# Altium schematic sheet EMGfrontend.SchDoc
size A; SheetNumber: 2; SheetTotal: 8
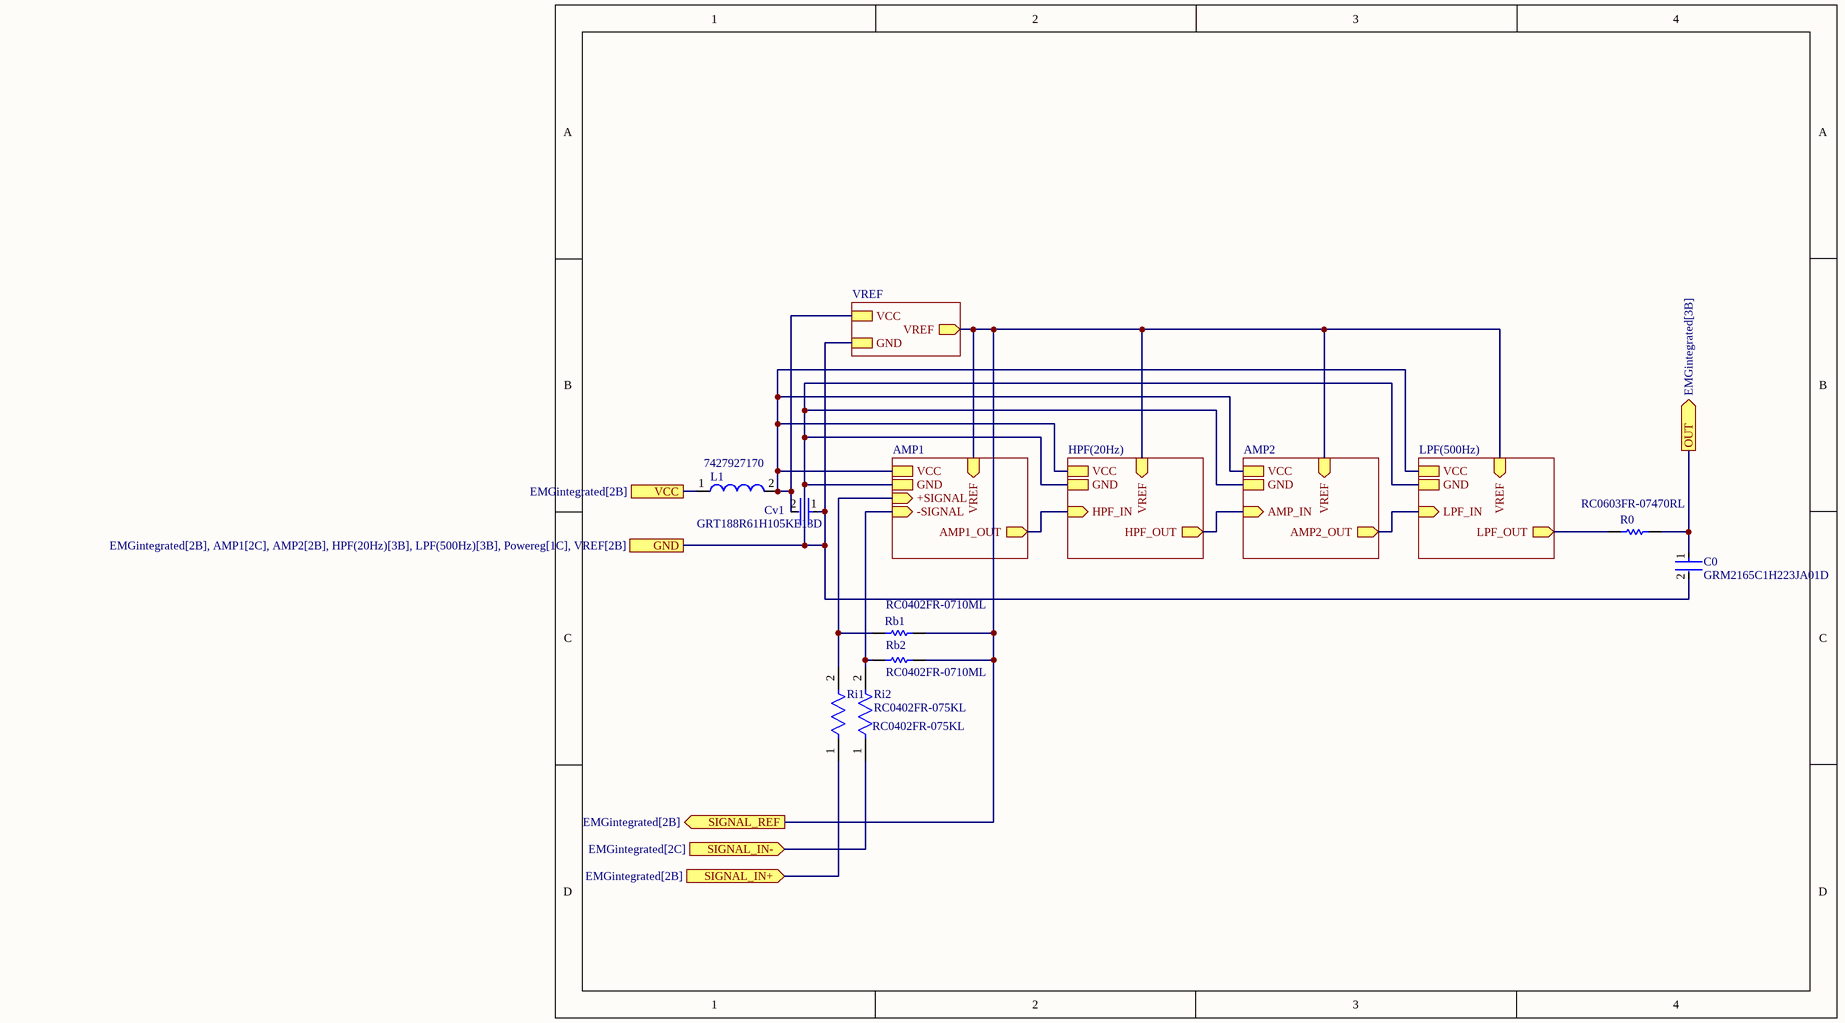
[diagram p0: EMGfrontend.SchDoc]

## Parts
C0  GRM2165C1H223JA01D  [FP-GRM216-0_1-0_05-D]
Cv1  GRT188R61H105KE13D  [FP-GRT188-0_1-e0_2_0_5-IPC_B]
L1  7427927170  [SMD-0402]
R0  RC0603FR-07470RL  [RESC1608X55X25LL10T15]
Rb1  RC0402FR-0710ML  [RESC1005X40X25MML05T10]
Rb2  RC0402FR-0710ML  [RESC1005X40X25MML05T10]
Ri1  RC0402FR-075KL  [FP-RC0402-MFG-TINY]
Ri2  RC0402FR-075KL  [FP-RC0402-MFG-TINY]

## Sub-sheets
AMP1 = AMP1.SchDoc: VREF (in), +SIGNAL (in), AMP1_OUT (out), GND, VCC, -SIGNAL (in)
AMP2 = AMP2.SchDoc: VREF (in), AMP_IN (in), VCC, GND, AMP2_OUT (out)
HPF(20Hz) = HPF(20Hz).SchDoc: HPF_IN (in), VREF (in), HPF_OUT (out), VCC, GND
LPF(500Hz) = LPF(500Hz).SchDoc: LPF_IN (in), VCC, GND, VREF (in), LPF_OUT (out)
VREF = VREF.SchDoc: VREF (out), VCC, GND

## Ports
GND (see EMGintegrated[2B], AMP1[2C], AMP2[2B], HPF(20Hz)[3B], LPF(500Hz)[3B], Powereg[1C], VREF[2B]), OUT (out, see EMGintegrated[3B]), SIGNAL_IN+ (in, see EMGintegrated[2B]), SIGNAL_IN- (in, see EMGintegrated[2C]), SIGNAL_REF (out, see EMGintegrated[2B]), VCC (see EMGintegrated[2B])

## Nets
GND: C0.2 Cv1.1 ; port GND, sheet VREF/GND, sheet AMP2/GND, sheet LPF(500Hz)/GND, sheet AMP1/GND, sheet HPF(20Hz)/GND
OUT: C0.1 R0.2 ; port OUT
SIGNAL_IN+: Ri1.1 ; port SIGNAL_IN+
SIGNAL_IN-: Ri2.1 ; port SIGNAL_IN-
SIGNAL_REF: Rb1.2 Rb2.2 ; port SIGNAL_REF, sheet VREF/VREF, sheet AMP2/VREF, sheet LPF(500Hz)/VREF, sheet AMP1/VREF, sheet HPF(20Hz)/VREF
VCC: L1.1 ; port VCC
NetCv1_2: Cv1.2 L1.2 ; sheet VREF/VCC, sheet AMP2/VCC, sheet LPF(500Hz)/VCC, sheet AMP1/VCC, sheet HPF(20Hz)/VCC
NetR0_1: R0.1 ; sheet LPF(500Hz)/LPF_OUT
NetRb1_1: Rb1.1 Ri1.2 ; sheet AMP1/+SIGNAL
NetRb2_1: Rb2.1 Ri2.2 ; sheet AMP1/-SIGNAL
(unnamed): sheet AMP2/AMP_IN, sheet HPF(20Hz)/HPF_OUT
(unnamed): sheet AMP2/AMP2_OUT, sheet LPF(500Hz)/LPF_IN
(unnamed): sheet AMP1/AMP1_OUT, sheet HPF(20Hz)/HPF_IN

## Library data of the parts
C0 = CMP-06035-050815-1: Chip Multilayer Ceramic Capacitors for General Purpose, 0805, 22000pF, C0G, 30ppm/°C, 5%, 50V
Cv1 = CMP-06035-031856-1: Multi-Layer Ceramic Capacitor 1uF 50V X5R ±10% 0603 Paper T/R; Voltage Rating (DC): 50V; Voltage Rating: 50V; Min Operating Temperature: -55°C; Case Code (Metric): 1608; Thickness: 0.035inch; Width: 0.031inch; Capacitance: 1uF; Tolerance: 10%; Max Operating Temperature: 85°C; Dielectric: X5R; Case Code (Imperial): 0603; Case/Package: 0603; Length: 0.063inch; Packaging: Tape and Reel; Mount: Surface Mount; Ratings: AEC-Q200
L1 = CMP-0220-00142-1: SMD EMI Suppression Ferrite Bead WE-CBF, Z = 75 Ohm; Impedance: 75 Ohm; ComponentLink2Description: Datasheet; ComponentLink2URL: http://www.we-online.de/katalog/media/pdf/7427927170.pdf; ComponentLink1URL: http://www.we-online.com; PackageVersion: 2009; ComponentLink1Description: Manufacturer Link; PackageReference: SMD-0402; PackageDescription: Chip Inductor, 2-Leads, Body 1.0 x 0.5 mm; DatasheetVersion: ver 1, Jul-2009
R0 = CMP-1659-00035-2: General Purpose Chip Resistor, 470 Ohm, +/- 1%, -55 to 155 degC, 0603 (1608 Metric), RoHS, Tape and Reel; Resistance: 470 Ohm; ComponentLink1Description: Manufacturer URL; Contact Plating: Gold; Width: 3.1 mm; Radiation Hardening: No; DatasheetVersion: Rev. 4, 04/2009; Length: 3 mm; PackageDescription: 2-Pin Surface Mount Device, Body 1.6 x 0.8 mm; ComponentLink1URL: http://www.yageo.com/; Min Operating Temperature: -40 degC; Mount: Surface Mount; Package Quantity: 2500; ComponentLink2URL: https://datasheet.ciiva.com/11808/0900766b80f96399-11808177.pdf; RoHSCompliant: true; Fastening Type: Snap; PackageReference: 0603; Max Operating Temperature: 90 degC; Height: 1.25 mm; Packaging: Tape and Reel; ComponentLink2Description: Datasheet; Contact Material: Brass
Rb1 Rb2 = CMP-2002-07354-1: Manufacturer: Yageo / Phycomp; Part Number: RC0402FR-0710ML
Ri1 Ri2 = CMP-03412-013078-1: RES SMD 5K OHM 1% 1/16W 0402; Manufacturer: Yageo; Resistance: 5kΩ; Temperature Coefficient: 100ppm/°C; Power Rating: 0.0625W; Voltage Rating: 50V; Value: 5kΩ; Temperature Range Low: -55°C; Lead Free: Yes; RoHS: TRUE; Device Class L2: Resistors; Package: RC0402; Footprint Url: https://pccomponents.com/datasheets/YAGEO-20RESISTORS.PDF; Height: 0.4mm; ComponentLink2URL: http://www.yageo.com/documents/recent/PYu-RC_Group_51_RoHS_L_10.pdf; Temperature: -55°C to +155°C; Composition: Thick Film; Device Class L1: Passive Components; Series: RC_L; Ipc Land Pattern Name: RESC10050X35; Tolerance: 1%; Device Class L3: Chip SMD Resistors; Temperature Range High: +155°C; Category: Res; Automotive: No; Octopart: https://octopart.com/rc0402fr-075kl-yageo-25450038; Digikey Description: RES SMD 5K OHM 1% 1/16W 0402; ComponentLink2Description: Datasheet; Manufacturer Part Number: RC0402FR-075KL